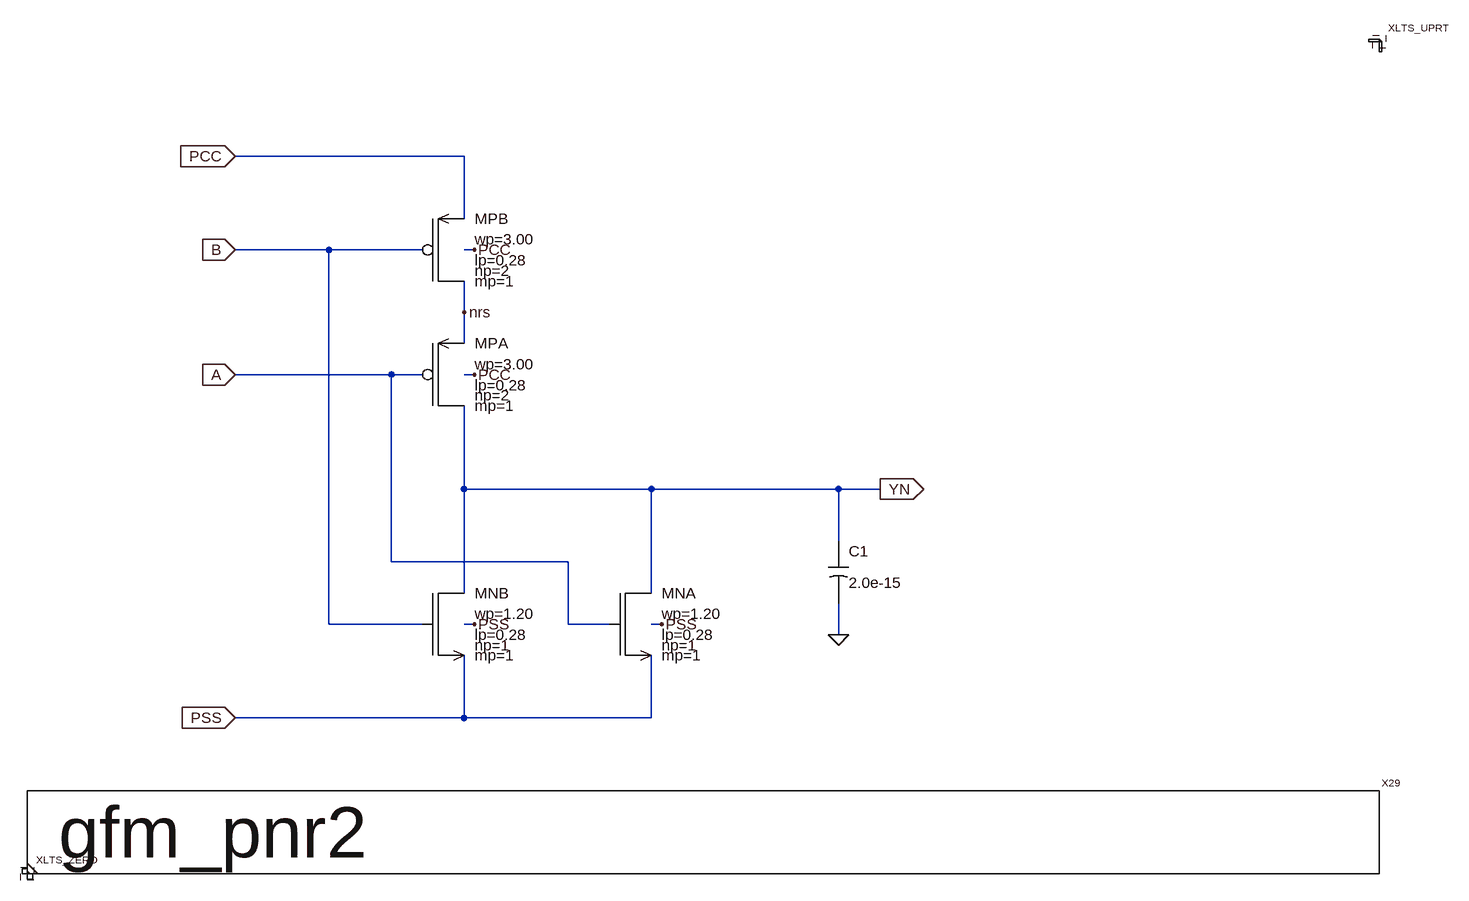
[diagram p0: schematic gfm_pnr2.asc]
gfm_pnr2.asc, the LTspice schematic file:
Version 4
SHEET 1 4552 4336
WIRE 672 -1104 320 -1104
WIRE 672 -1008 672 -1104
WIRE 464 -960 320 -960
WIRE 608 -960 464 -960
WIRE 688 -960 672 -960
WIRE 672 -864 672 -912
WIRE 672 -816 672 -864
WIRE 560 -768 320 -768
WIRE 608 -768 560 -768
WIRE 688 -768 672 -768
WIRE 672 -592 672 -720
WIRE 960 -592 672 -592
WIRE 1248 -592 960 -592
WIRE 1312 -592 1248 -592
WIRE 1248 -512 1248 -592
WIRE 560 -480 560 -768
WIRE 832 -480 560 -480
WIRE 672 -432 672 -592
WIRE 960 -432 960 -592
WIRE 464 -384 464 -960
WIRE 608 -384 464 -384
WIRE 688 -384 672 -384
WIRE 832 -384 832 -480
WIRE 896 -384 832 -384
WIRE 976 -384 960 -384
WIRE 1248 -368 1248 -416
WIRE 672 -240 672 -336
WIRE 672 -240 320 -240
WIRE 960 -240 960 -336
WIRE 960 -240 672 -240
FLAG 320 -240 PSS
IOPIN 320 -240 In
FLAG 320 -960 B
IOPIN 320 -960 In
FLAG 320 -1104 PCC
IOPIN 320 -1104 In
FLAG 1312 -592 YN
IOPIN 1312 -592 Out
FLAG 1248 -368 0
FLAG 688 -384 PSS
FLAG 688 -768 PCC
FLAG 688 -960 PCC
FLAG 976 -384 PSS
FLAG 672 -864 nrs
FLAG 320 -768 A
IOPIN 320 -768 In
SYMBOL BD_GTitleLTS 0 0 R0
SYMATTR InstName X29
SYMATTR SpiceModel gfm_pnr2
SYMBOL gfmcu_pmos3p3 608 -768 R0
SYMATTR InstName MPA
SYMATTR SpiceLine np=2
SYMATTR Value wp=3.00
SYMATTR Value2 lp=0.28
SYMBOL gfmcu_pmos3p3 608 -960 R0
SYMATTR InstName MPB
SYMATTR SpiceLine np=2
SYMATTR Value wp=3.00
SYMATTR Value2 lp=0.28
SYMBOL gfmcu_nmos3p3 896 -384 R0
SYMATTR InstName MNA
SYMATTR Value wp=1.20
SYMATTR Value2 lp=0.28
SYMBOL gfmcu_nmos3p3 608 -384 R0
SYMATTR InstName MNB
SYMATTR Value wp=1.20
SYMATTR Value2 lp=0.28
SYMBOL gcap 1248 -512 R0
SYMATTR InstName C1
SYMATTR Value 2.0e-15
SYMBOL BD_ZERO 0 0 R0
SYMATTR InstName XLTS_ZERO
SYMBOL BD_UPRT 2080 -1280 R0
SYMATTR InstName XLTS_UPRT

The netlist it stands for:
* gfm_pnr2.asc
XX29 BD_GTitleLTS
XMPA YN A nrs PCC gfmcu_pmos3p3 wp=3.00 lp=0.28 np=2 mp=1  ; pins ND NG NS NB
XMPB nrs B PCC PCC gfmcu_pmos3p3 wp=3.00 lp=0.28 np=2 mp=1  ; pins ND NG NS NB
XMNA YN A PSS PSS gfmcu_nmos3p3 wp=1.20 lp=0.28 np=1 mp=1  ; pins ND NG NS NB
XMNB YN B PSS PSS gfmcu_nmos3p3 wp=1.20 lp=0.28 np=1 mp=1  ; pins ND NG NS NB
C1 YN 0 2.0e-15
XXLTS_ZERO BD_ZERO
XXLTS_UPRT BD_UPRT
.lib models_gfmcu.lib
.lib dmodels_analog.lib
.backanno
.end